# Altium project pcb_micro.PrjPcb
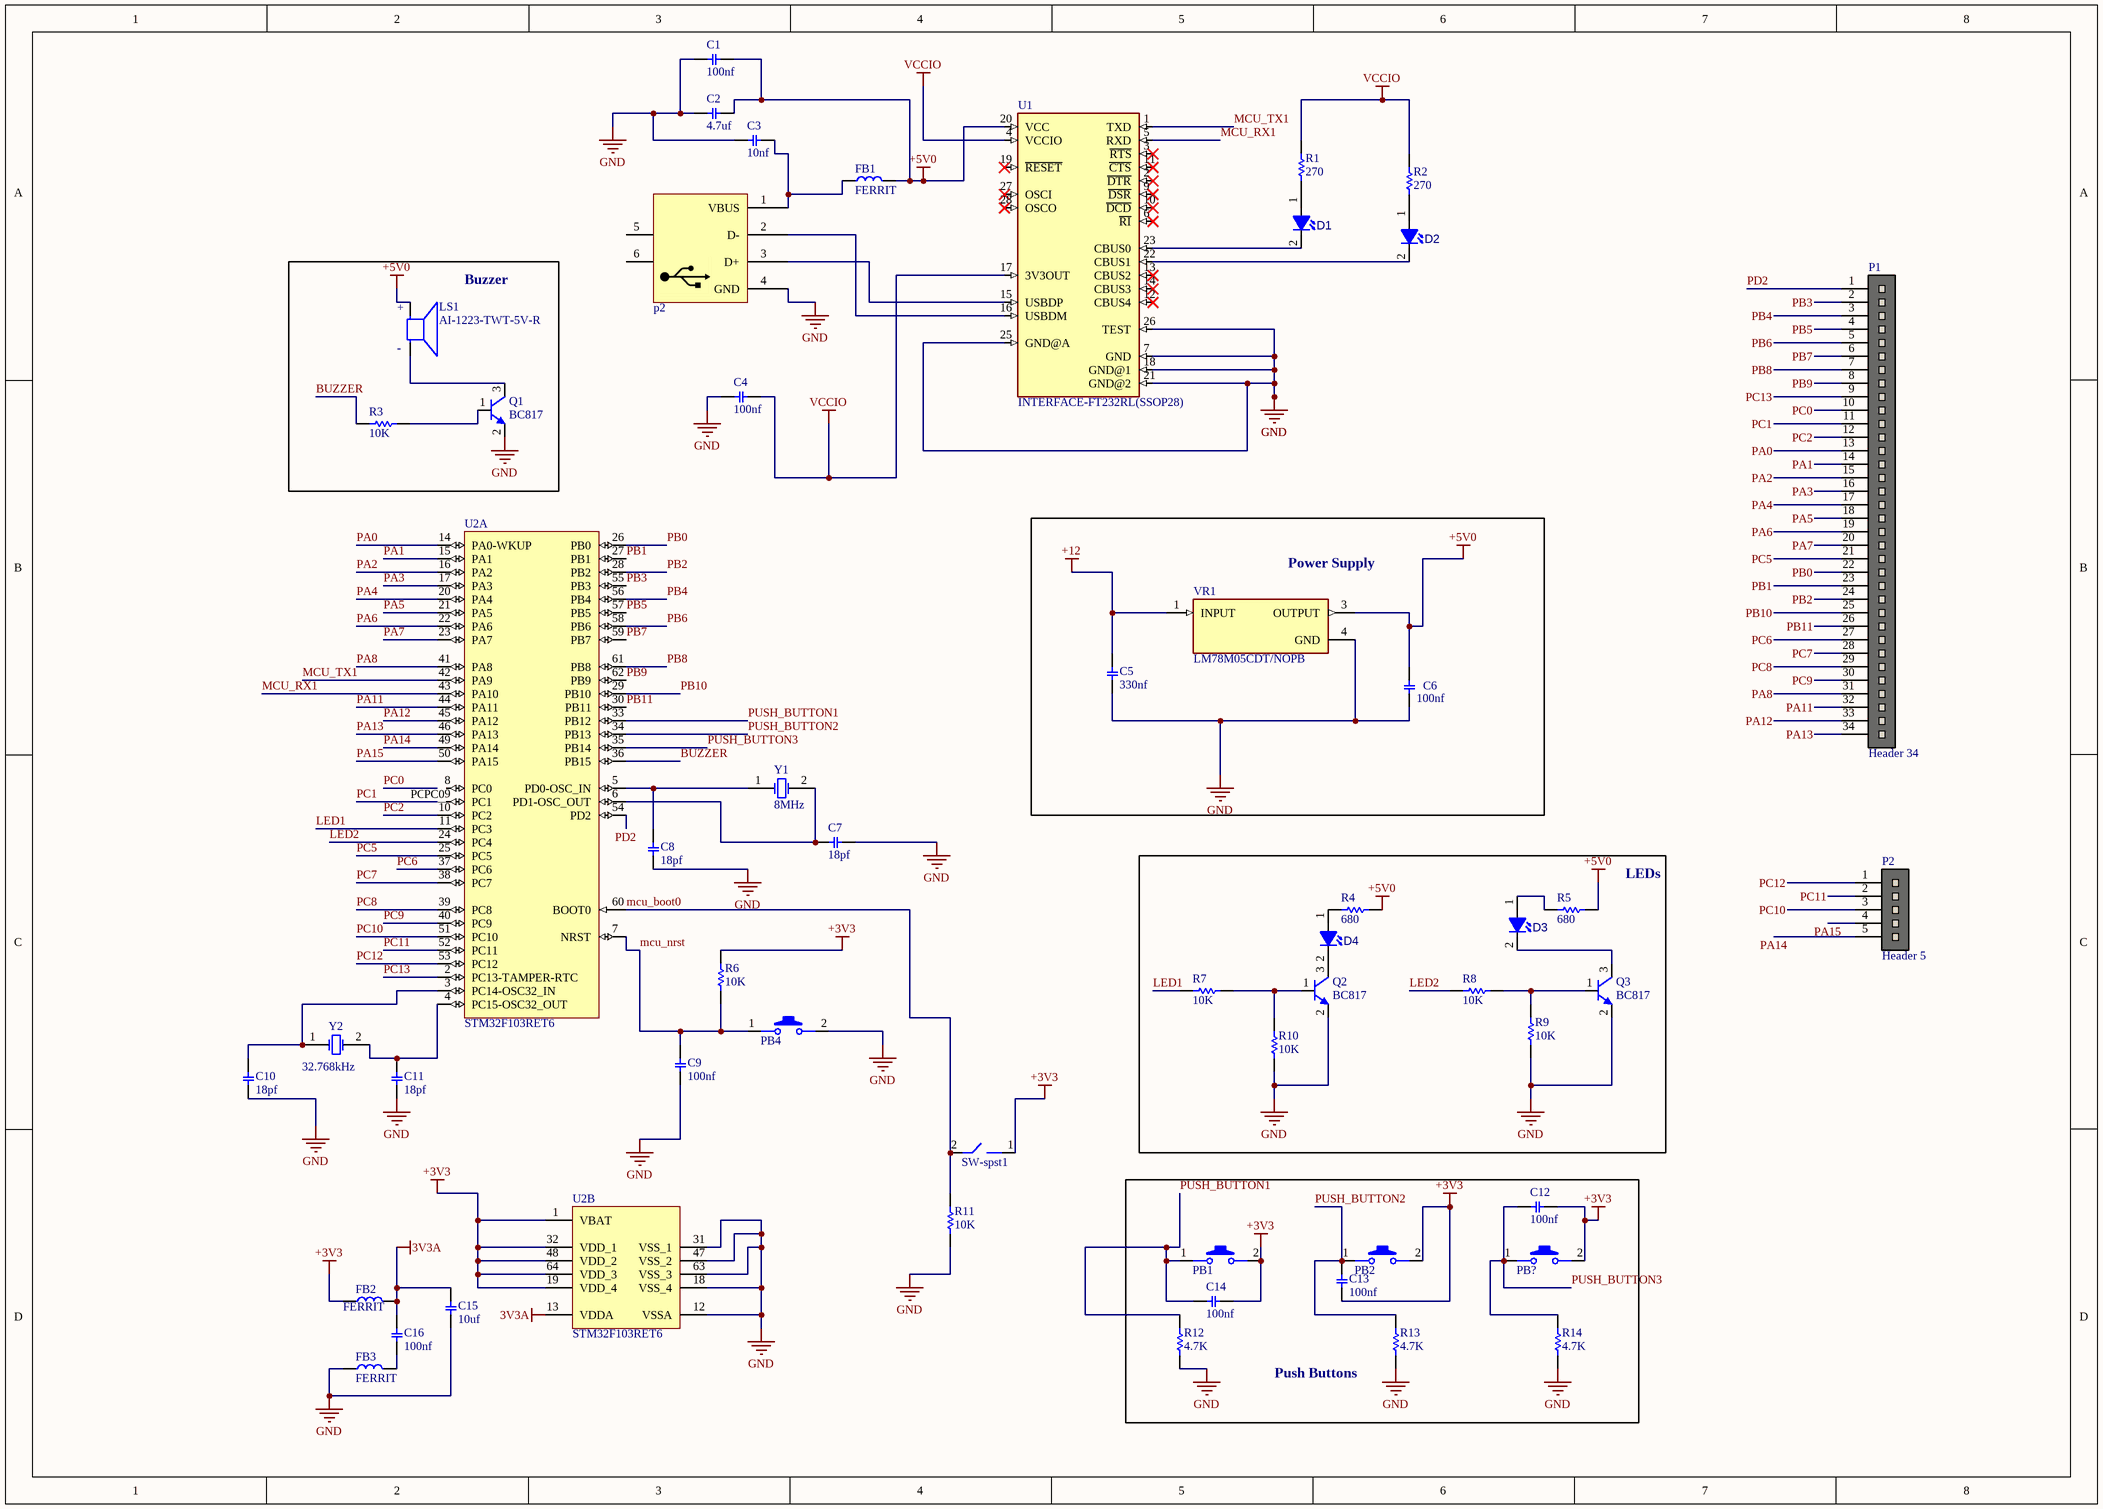
[diagram p0: Sheet1.SchDoc]
1 sheet, 54 parts. Net scope: global (net labels, ports and power ports of the same name join across sheets).
Board file: PCB1.PcbDoc

## Sheet Sheet1.SchDoc
size A3; SheetNumber: 1; SheetTotal: 1; SPICEModelCacheVMSFURSI: <root> / <DocumentId>VMSFURSI</DocumentId> / <CacheFrame Number="0"> / <Model Name="xtal" Kind="CKT"> / <Text>*Generic type:crystal pkg:HC33/51 / .SUBCKT XTAL 1 2 PARAMS: FREQ=1Meg RS=750 C=13pf Q=1000 / LX 1 3 {((Q*RS)/(6.2831852*FREQ))} IC=0.5M / CX 3 4 {(1/(Q*6.2831852*FREQ*RS))} / C0 1 2 {C} / RS 4 2 {RS} / .ENDS XTAL</Text> / </Model> / </CacheFrame> / </root>

### Parts
(Parts that share a designator on the sheet are numbered #1, #2 ... from top to bottom, then left to right.)
C1  value 100nf  [C1206]  (hidden comment: Capacitor C SMD 1206)
C2  value 4.7uf  [C1206]  (hidden comment: Capacitor C SMD 1206)
C3  value 10nf  [C1206]  (hidden comment: Capacitor C SMD 1206)
C4  value 100nf  [C1206]  (hidden comment: Capacitor C SMD 1206)
C5  value 330nf  [C1206]  (hidden comment: Capacitor C SMD 1206)
C6  value 100nf  [C1206]  (hidden comment: Capacitor C SMD 1206)
C7  value 18pf  [C1206]  (hidden comment: Capacitor C SMD 1206)
C8  value 18pf  [C1206]  (hidden comment: Capacitor C SMD 1206)
C9  value 100nf  [C1206]  (hidden comment: Capacitor C SMD 1206)
C10  value 18pf  [C1206]  (hidden comment: Capacitor C SMD 1206)
C11  value 18pf  [C1206]  (hidden comment: Capacitor C SMD 1206)
C12  value 100nf  [C1206]  (hidden comment: Capacitor C SMD 1206)
C13  value 100nf  [C1206]  (hidden comment: Capacitor C SMD 1206)
C14  value 100nf  [C1206]  (hidden comment: Capacitor C SMD 1206)
C15  value 10uf  [C1206]  (hidden comment: Capacitor C SMD 1206)
C16  value 100nf  [C1206]  (hidden comment: Capacitor C SMD 1206)
D1  LED SMD 1210  [LED SMD 1210 (Yellow)]  (value not drawn)
D2  LED SMD 1210  [LED SMD 1210 (Yellow)]  (value not drawn)
D3  LED SMD 1210  [LED SMD 1210 (Yellow)]  (value not drawn)
D4  LED SMD 1210  [LED SMD 1210 (Yellow)]  (value not drawn)
FB1  Inductor SMD NC 0806  [L0806]  (value not drawn)
FB2  Inductor SMD NC 0806  [L0806]  (value not drawn)
FB3  Inductor SMD NC 0806  [L0806]  (value not drawn)
LS1  AI-1223-TWT-5V-R  [XDCR_AI-1223-TWT-5V-R]
P1  Header 34  [HDR 1X34]
p2#1  USB  [USB2.5-2H4F]  (value not drawn)
P2#2  Header 5  [HDR 1X5]
PB1  SW_PB2  [SMD_ALPS_SKQMBBE010]  (value not drawn)
PB2  SW_PB2  [SMD_ALPS_SKQMBBE010]  (value not drawn)
PB3  SW_PB2  [SMD_ALPS_SKQMBBE010]  (value not drawn)
PB4  SW_PB2  [SMD_ALPS_SKQMBBE010]  (value not drawn)
Q1  value BC817  [SOT-23]  (hidden comment: BC817 NPN)
Q2  value BC817  [SOT-23]  (hidden comment: BC817 NPN)
Q3  value BC817  [SOT-23]  (hidden comment: BC817 NPN)
R1  value 270  [SMD-0805-RES]  (hidden comment: Resistor SMD 0805)
R2  value 270  [SMD-0805-RES]  (hidden comment: Resistor SMD 0805)
R3  value 10K  [SMD-0805-RES]  (hidden comment: Resistor SMD 0805)
R4  value 680  [SMD-0805-RES]  (hidden comment: Resistor SMD 0805)
R5  value 680  [SMD-0805-RES]  (hidden comment: Resistor SMD 0805)
R6  value 10K  [SMD-0805-RES]  (hidden comment: Resistor SMD 0805)
R7  value 10K  [SMD-0805-RES]  (hidden comment: Resistor SMD 0805)
R8  value 10K  [SMD-0805-RES]  (hidden comment: Resistor SMD 0805)
R9  value 10K  [SMD-0805-RES]  (hidden comment: Resistor SMD 0805)
R10  value 10K  [SMD-0805-RES]  (hidden comment: Resistor SMD 0805)
R11  value 10K  [SMD-0805-RES]  (hidden comment: Resistor SMD 0805)
R12  value 4.7K  [SMD-0805-RES]  (hidden comment: Resistor SMD 0805)
R13  value 4.7K  [SMD-0805-RES]  (hidden comment: Resistor SMD 0805)
R14  value 4.7K  [SMD-0805-RES]  (hidden comment: Resistor SMD 0805)
SW-spst1  SW SPDT 1  [SWSLIDT_SPST_S_19X11]  (value not drawn)
U1  INTERFACE-FT232RL(SSOP28)  [SSOP28-0.65-10.2X5.2MM]
U2  STM32F103RET6  [STM-LQFP64_N]  (parts A,B of 2)
VR1  LM78M05CDT/NOPB  [TO228P991X255-3N]
Y1  8MHz  [HC-49U]
Y2  32.768kHz  [HC-49U]

### Blocks framed on the sheet
Buzzer: LS1 Q1 R3
Power Supply: C5 C6 VR1
LEDs: D3 D4 Q2 Q3 R4 R5 R7-R10
Push Buttons: C12-C14 PB1-PB3 R12-R14

### Nets
3V3A: C15.1 C16.2 FB2.2 U2.13(VDDA)
+3V3: C12.1 C13.1 C14.2 FB2.1 PB1.2 PB2.2 PB3.2 R6.2 SW-spst1.1 U2.1(VBAT) U2.19(VDD_4) U2.32(VDD_1) U2.48(VDD_2) U2.64(VDD_3)
+5V0: C1.1 C2.1 C6.2 FB1.2 LS1.P R4.1 R5.1 U1.20(VCC) VR1.3(OUTPUT)
+12: C5.2 VR1.1(INPUT)
GND: C1.2 C2.2 C3.2 C4.2 C5.1 C6.1 C7.1 C8.1 C9.1 C10.1 C11.1 C15.2 FB3.1 p2#1.4(GND) PB4.2 Q1.2(E) Q2.2(E) Q3.2(E) R9.1 R10.1 R11.1 R12.1 R13.1 R14.1 U1.7(GND) U1.18(GND@1) U1.21(GND@2) U1.25(GND@A) U1.26(TEST) U2.12(VSSA) U2.18(VSS_4) U2.31(VSS_1) U2.47(VSS_2) U2.63(VSS_3) VR1.4(GND)
VCCIO: C4.1 R1.1 R2.1 U1.4(VCCIO) U1.17(3V3OUT)
BUZZER: R3.2 U2.36(PB15)
LED1: R7.2 U2.11(PC3)
LED2: R8.2 U2.24(PC4)
mcu_boot0: R11.2 SW-spst1.2 U2.60(BOOT0)
mcu_nrst: C9.2 PB4.1(Button) R6.1 U2.7(NRST)
MCU_RX1: U1.5(RXD) U2.43(PA10)
MCU_TX1: U1.1(TXD) U2.42(PA9)
PA0: P1.13 U2.14(PA0-WKUP)
PA1: P1.14 U2.15(PA1)
PA2: P1.15 U2.16(PA2)
PA3: P1.16 U2.17(PA3)
PA4: P1.17 U2.20(PA4)
PA5: P1.18 U2.21(PA5)
PA6: P1.19 U2.22(PA6)
PA7: P1.20 U2.23(PA7)
PA8: P1.31 U2.41(PA8)
PA11: P1.32 U2.44(PA11)
PA12: P1.33 U2.45(PA12)
PA13: P1.34 U2.46(PA13)
PA14: P2#2.5 U2.49(PA14)
PA15: P2#2.4 U2.50(PA15)
PB0: P1.22 U2.26(PB0)
PB1: P1.23 U2.27(PB1)
PB2: P1.24 U2.28(PB2)
PB3: P1.2 U2.55(PB3)
PB4: P1.3 U2.56(PB4)
PB5: P1.4 U2.57(PB5)
PB6: P1.5 U2.58(PB6)
PB7: P1.6 U2.59(PB7)
PB8: P1.7 U2.61(PB8)
PB9: P1.8 U2.62(PB9)
PB10: P1.25 U2.29(PB10)
PB11: P1.26 U2.30(PB11)
PC0: P1.10 U2.8(PC0)
PC1: P1.11 U2.9(PC1)
PC2: P1.12 U2.10(PC2)
PC5: P1.21 U2.25(PC5)
PC6: P1.27 U2.37(PC6)
PC7: P1.28 U2.38(PC7)
PC8: P1.29 U2.39(PC8)
PC9: P1.30 U2.40(PC9)
PC10: P2#2.3 U2.51(PC10)
PC11: P2#2.2 U2.52(PC11)
PC12: P2#2.1 U2.53(PC12)
PC13: P1.9 U2.2(PC13-TAMPER-RTC)
PD2: P1.1 U2.54(PD2)
PUSH_BUTTON1: C14.1 PB1.1(Button) R12.2 U2.33(PB12)
PUSH_BUTTON2: C13.2 PB2.1(Button) R13.2 U2.34(PB13)
PUSH_BUTTON3: C12.2 PB3.1(Button) R14.2 U2.35(PB14)
NetC3_1: C3.1 FB1.1 p2#1.1(VBUS)
NetC7_2: C7.2 U2.6(PD1-OSC_OUT) Y1.2(OSC2)
NetC8_2: C8.2 U2.5(PD0-OSC_IN) Y1.1(OSC1)
NetC10_2: C10.2 U2.3(PC14-OSC32_IN) Y2.1(OSC1)
NetC11_2: C11.2 U2.4(PC15-OSC32_OUT) Y2.2(OSC2)
NetC16_1: C16.1 FB3.2
NetD1_1: D1.1(ANODE) R1.2
NetD1_2: D1.2(CATHODE) U1.23(CBUS0)
NetD2_1: D2.1(ANODE) R2.2
NetD2_2: D2.2(CATHODE) U1.22(CBUS1)
NetD3_1: D3.1(ANODE) R5.2
NetD3_2: D3.2(CATHODE) Q3.3(C)
NetD4_1: D4.1(ANODE) R4.2
NetD4_2: D4.2(CATHODE) Q2.3(C)
NetLS1_N: LS1.N Q1.3(C)
Netp2#1_2: p2#1.2(D-) U1.16(USBDM)
Netp2#1_3: p2#1.3(D+) U1.15(USBDP)
NetQ1_1: Q1.1(B) R3.1
NetQ2_1: Q2.1(B) R7.1 R10.2
NetQ3_1: Q3.1(B) R8.1 R9.2

Not connected (* = marked no-connect by the designer): p2#1 5 6; U1 2(~{DTR})* 3(~{RTS})* 6(~{RI})* 9(~{DSR})* 10(~{DCD})* 11(~{CTS})* 12(CBUS4)* 13(CBUS2)* 14(CBUS3)* 19(~{RESET})* 27(OSCI)* 28(OSCO)*

### Notes on the sheet
- (near U2) PC0
- (in symbol AI-1223-TWT-5V-R) +; -

### Library data of the parts
LS1 = AI-1223-TWT-5V-R: INDICATOR 5VDC 85DB 2300HZ; Value: 1K; MF: PUI Audio; SnapEDA_Link: https://www.snapeda.com/parts/AI-1223-TWT-5V-R/PUI+Audio%252C+Inc./view-part/?ref=snap; Package: 2225 PUI Audio; MP: AI-1223-TWT-5V-R; Check_prices: https://www.snapeda.com/parts/AI-1223-TWT-5V-R/PUI+Audio%252C+Inc./view-part/?ref=eda
P1 = Header 34: Header, 34-Pin; ComponentLinkp-URL: https://www.smartw.ir/; ComponentLinkp-URL: 2020
p2#1 = USB: USB Connector-B Type; DatasheetVersion: 2021; ComponentLink1Description: Website Smart World; ComponentLink1URL: https://www.smartw.ir/; ComponentLink2Description: Telegram; ComponentLink2URL: https://t.me/altium_smartw; ComponentLink3Description: Instagram; ComponentLink3URL: https://Instagram.com/smartgw.ir
P2#2 = Header 5: Header, 5-Pin; ComponentLinkp-URL: https://www.smartw.ir/; DatasheetVersion: 2020
PB1-PB4 = SW_PB2: 2 Pin Push Button Switch; Company: SJ Libraries; Designer: Eng. Saeid Jorablo; Mounting Technology: Surface Mount\Through-Hole; ComponentLink1Description: Datasheet; Pin Count: 0; Update Date: 6/3/2012; Category: MISC; HelpURL: http://s3.picofile.com/file/7443264187/Coming_Soon_logo.gif
Q1-Q3 = BC817 NPN: BJT, NPN, 45v, 0.5A, SMD, SOT23; ComponentLink1Description: Website Smart World; ComponentLink1URL: https://www.smartw.ir/; ComponentLink2Description: Telegram; ComponentLink2URL: https://t.me/altium_smartw; ComponentLink3Description: Instagram; ComponentLink3URL: https://Instagram.com/smartgw.ir; DatasheetVersion: 2021
SW-spst1 = SW SPDT 1: Toggle SPDT Switch with Body Hole; ComponentLink1Description: Website Smart World; ComponentLink1URL: https://www.smartw.ir/; ComponentLink2Description: Telegram; ComponentLink2URL: https://t.me/altium_smartw; ComponentLink3Description: Instagram; ComponentLink3URL: https://Instagram.com/smartgw.ir; DatasheetVersion: 2021
U1 = INTERFACE-FT232RL(SSOP28): USB-Ð¼Ð¾ÑÑ‚, Ð¸Ð½Ñ‚ÐµÑ€Ñ„ÐµÐ¹Ñ USB Ðº UART USB 2.0 UART 28-SSOP; MF: FTDI, Future; SnapEDA_Link: https://www.snapeda.com/parts/FT232RL/FTDI%252C+Future+Technology+Devices+International+Ltd/view-part/?ref=snap; Availability: Not in stock; MP: FT232RL; Price: None; Value: *; Check_prices: https://www.snapeda.com/parts/FT232RL/FTDI%252C+Future+Technology+Devices+International+Ltd/view-part/?ref=eda; Package: SSOP-28 FTDI
U2 = STM32F103RET6: ARM Cortex-M3 32-bit MCU, 512 KB Flash, 64 KB Internal RAM, 51 I/Os, 64-pin LQFP, -40 to 85 degC, Tray; ComponentLink1Description: Website Smart World; ComponentLink1URL: https://eshop.eca.ir/stm/1234-%D9%85%DB%8C%DA%A9%D8%B1%D9%88%DA%A9%D9%86%D8%AA%D8%B1%D9%84%D8%B1-stm32f103ret6.html; ComponentLink2Description: New link; ComponentLink2URL: *
VR1 = LM78M05CDT/NOPB: 500-mA, 35-V, linear voltage regulator for 5 V 3-TO-252 -40 to 125; MF: Texas Instruments; Package: TO-252-3 Texas Instruments; Value: *; Check_prices: https://www.snapeda.com/parts/LM78M05CDT/Texas%20Instruments/view-part/563725/?ref=eda; Purchase-URL: https://pricing.snapeda.com/search/part/LM78M05CDT/?ref=eda; SnapEDA_Link: https://www.snapeda.com/parts/LM78M05CDT/Texas%20Instruments/view-part/563725/?ref=snap; Availability: Good; Price: None; MP: LM78M05CDT
Y1 Y2 = ECS-44-20-1: Crystal Oscillator; Published: 17-Jul-2002; DatasheetDocument: 18-Apr-2000; PackageReference: HC-49U; Publisher: Altium Limited; ComponentLink1Description: Manufacturer Link; ComponentLink1URL: http://www.ecsxtal.com/; ComponentLink2Description: Datasheet; ComponentLink2URL: http://www.ecsxtal.com/pdf2/HC49U.PDF
C1-C16 = Capacitor C SMD 1206: DatasheetVersion: 2021; ComponentLink1Description: Website Smart World; ComponentLink1URL: https://www.smartw.ir/; ComponentLink2Description: Telegram; ComponentLink2URL: https://t.me/altium_smartw; ComponentLink3Description: Instagram; ComponentLink3URL: https://Instagram.com/smartgw.ir
D1-D4 = LED SMD 1210: ComponentLink1Description: Website Smart World; ComponentLink1URL: https://www.smartw.ir/; ComponentLink2Description: Telegram; ComponentLink2URL: https://t.me/altium_smartw; ComponentLink3Description: Instagram; ComponentLink3URL: https://Instagram.com/smartgw.ir; DatasheetVersion: 2021
FB1-FB3 = Inductor SMD NC 0806: DatasheetVersion: 2021; ComponentLink1Description: Website Smart World; ComponentLink1URL: https://www.smartw.ir/; ComponentLink2Description: Telegram; ComponentLink2URL: https://t.me/altium_smartw; ComponentLink3Description: Instagram; ComponentLink3URL: https://Instagram.com/smartgw.ir; FERRIT: FERRIT
R1-R14 = Resistor SMD 0805: DatasheetVersion: 2021; ComponentLink1Description: Website Smart World; ComponentLink1URL: https://www.smartw.ir/; ComponentLink2Description: Telegram; ComponentLink2URL: https://t.me/altium_smartw; ComponentLink3Description: Instagram; ComponentLink3URL: https://Instagram.com/smartgw.ir